# Altium project Wirless Battery Charger.PrjPcb
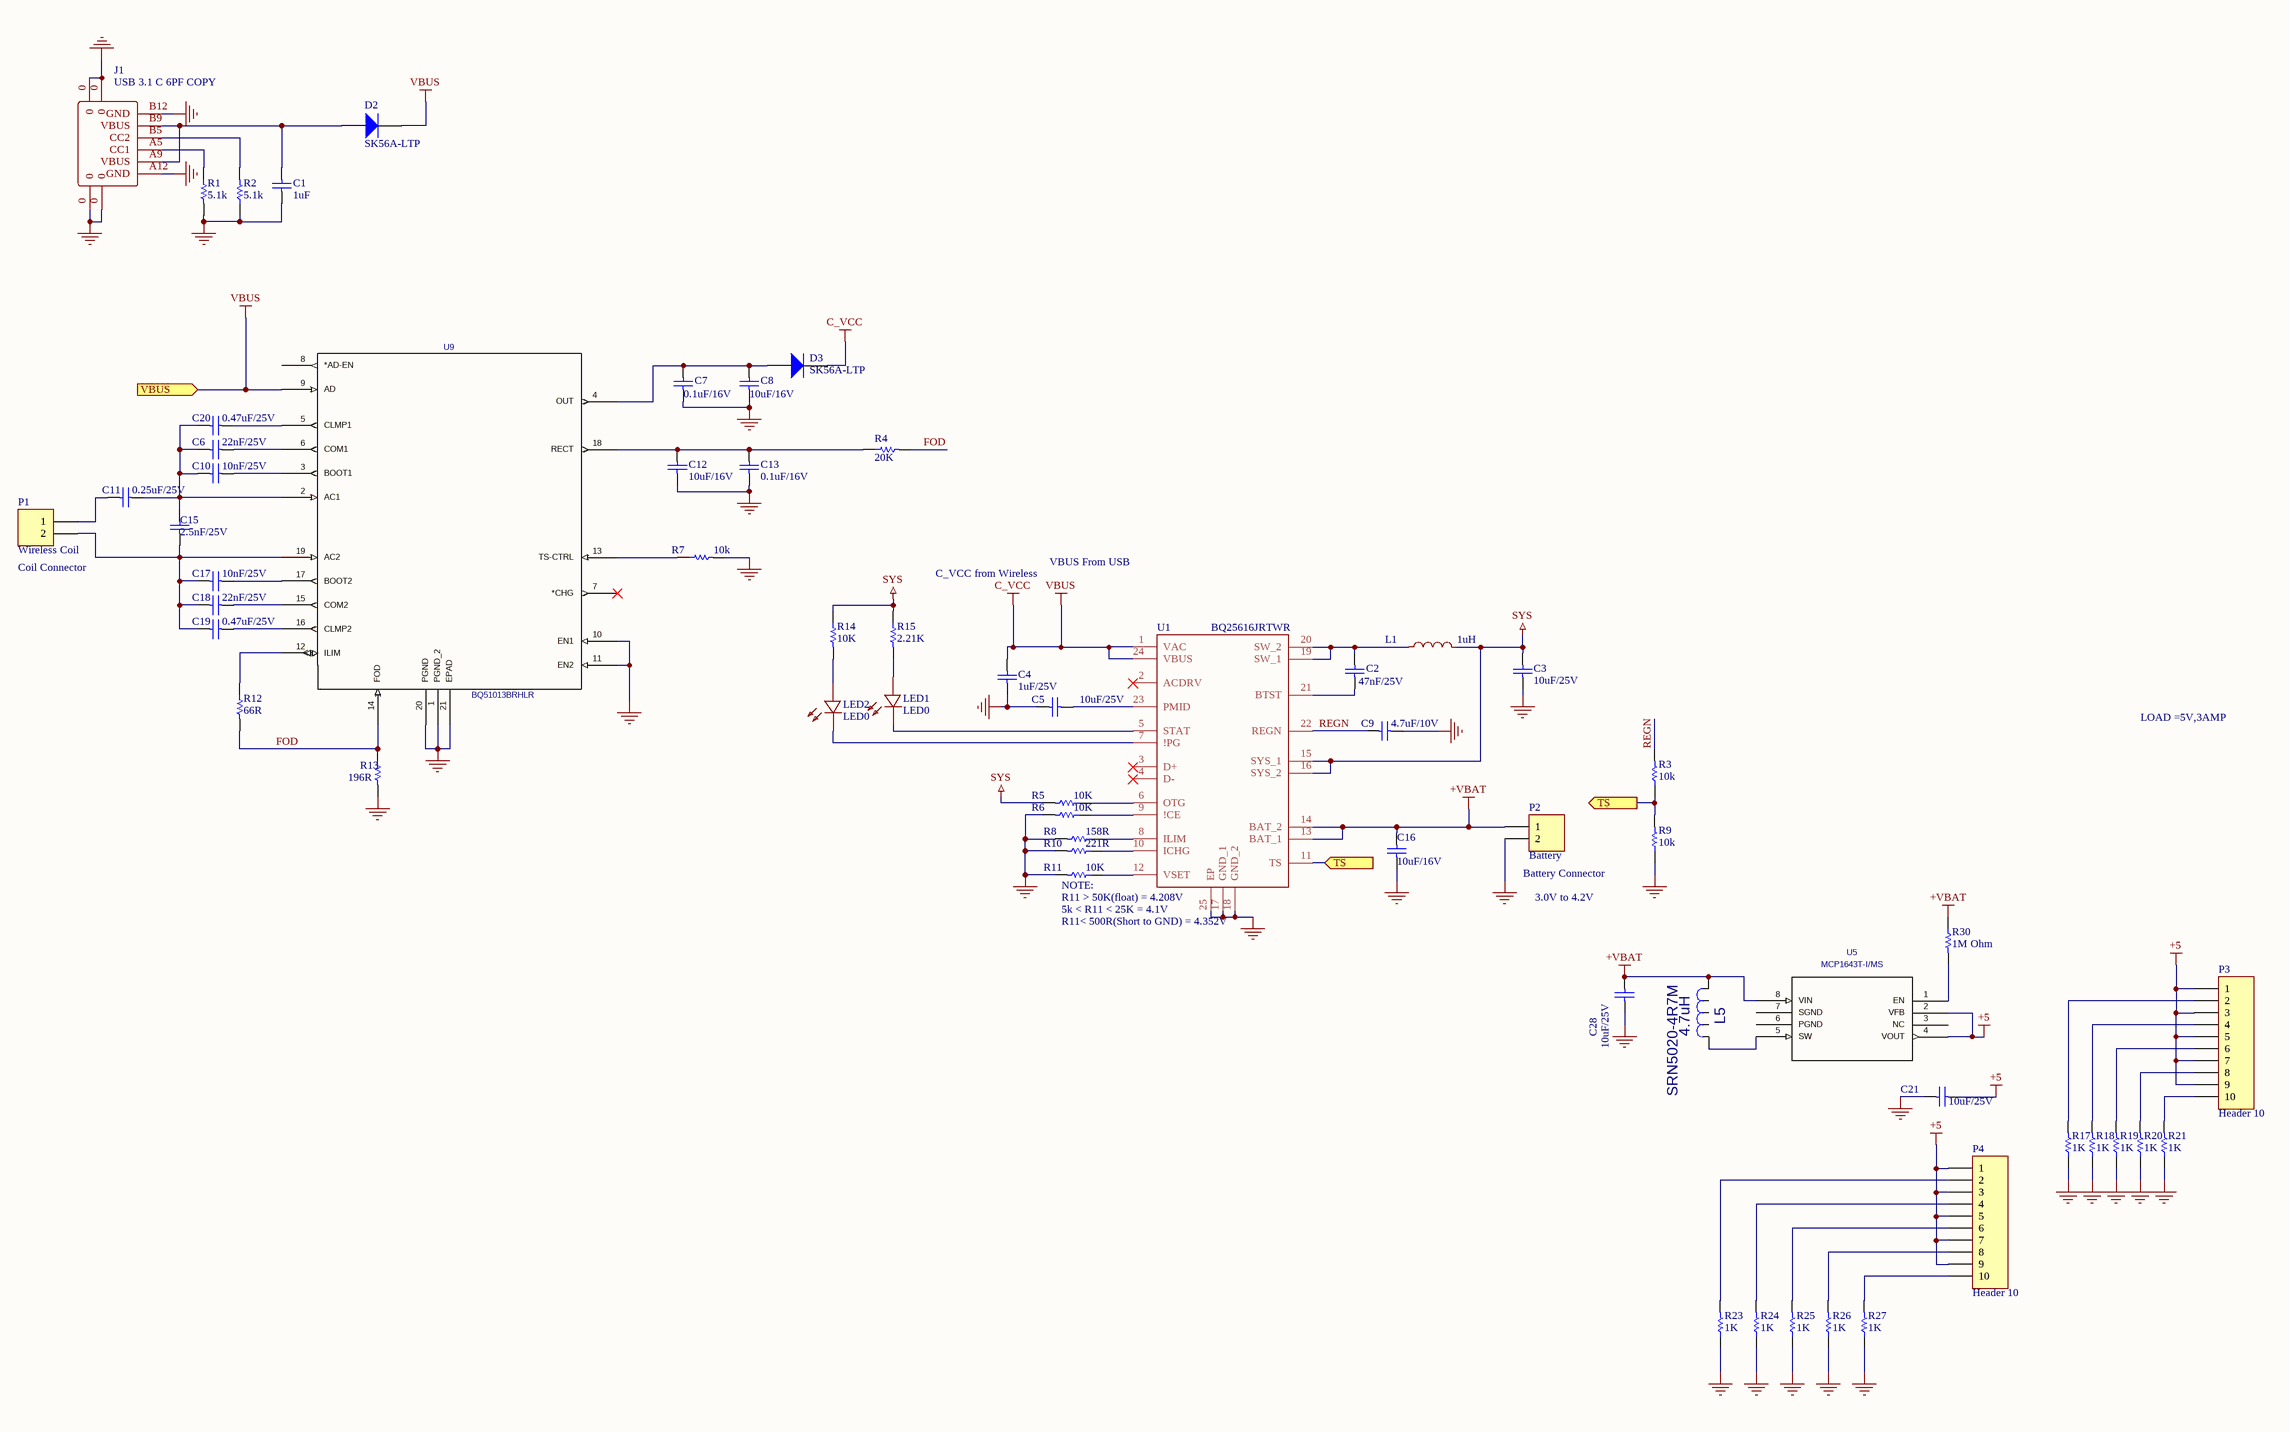
[diagram p0: BQ51013BYFPR_Circuit.SchDoc]
1 sheet, 61 parts. Net scope: flat (ports and power ports of the same name join across sheets).
Board file: PCB_BQ51013BYFPR.PcbDoc

## Sheet BQ51013BYFPR_Circuit.SchDoc
size C

### Parts
C1  value 1uF  [0805-CAP]  (hidden comment: Cap)
C2  value 47nF/25V  [0805-CAP]  (hidden comment: Cap)
C3  value 10uF/25V  [0805-CAP]  (hidden comment: Cap)
C4  value 1uF/25V  [0805-CAP]  (hidden comment: Cap)
C5  value 10uF/25V  [0805-CAP]  (hidden comment: Cap)
C6  value 22nF/25V  [0402-A]  (hidden comment: Cap)
C7  value 0.1uF/16V  [0402-A]  (hidden comment: Cap)
C8  value 10uF/16V  [0805-CAP]  (hidden comment: Cap)
C9  value 4.7uF/10V  [0805-CAP]  (hidden comment: Cap)
C10  value 10nF/25V  [0402-A]  (hidden comment: Cap)
C11  value 0.25uF/25V  [0402-A]  (hidden comment: Cap)
C12  value 10uF/16V  [0805-CAP]  (hidden comment: Cap)
C13  value 0.1uF/16V  [0402-A]  (hidden comment: Cap)
C15  value 2.5nF/25V  [0402-A]  (hidden comment: Cap)
C16  value 10uF/16V  [0805-CAP]  (hidden comment: Cap)
C17  value 10nF/25V  [0402-A]  (hidden comment: Cap)
C18  value 22nF/25V  [0402-A]  (hidden comment: Cap)
C19  value 0.47uF/25V  [0402-A]  (hidden comment: Cap)
C20  value 0.47uF/25V  [0402-A]  (hidden comment: Cap)
C21  value 10uF/25V  [0805-CAP]  (hidden comment: Cap)
C28  value 10uF/25V  [0805-CAP]  (hidden comment: Cap)
D2  SK56A-LTP  [SMC]
D3  SK56A-LTP  [SMC]
J1  USB 3.1 C 6PF COPY  [USB-C-SMD_TYPE-C-USB-13]
L1  1uH  [IND-SMD_L4.1-W3.2]
L5  4.7uH  value SRN5020-4R7M  [IND_BOURNS_SRN50]
LED1  LED0  [1608[0603]_LED]
LED2  LED0  [1608[0603]_LED]
P1  Wireless Coil  [HDR1X2]
P2  Battery  [HDR1X2]
P3  Header 10  [HDR1X10]
P4  Header 10  [HDR1X10]
R1  value 5.1k  [1608[0603]]  (hidden comment: Res1)
R2  value 5.1k  [1608[0603]]  (hidden comment: Res1)
R3  value 10k  [0402-A]  (hidden comment: Res1)
R4  value 20K  [0402-A]  (hidden comment: Res1)
R5  value 10K  [0402-A]  (hidden comment: Res1)
R6  value 10K  [0402-A]  (hidden comment: Res1)
R7  value 10k  [0402-A]  (hidden comment: Res1)
R8  value 158R  [0402-A]  (hidden comment: Res1)
R9  value 10k  [0402-A]  (hidden comment: Res1)
R10  value 221R  [0402-A]  (hidden comment: Res1)
R11  value 10K  [0402-A]  (hidden comment: Res1)
R12  value 66R  [0402-A]  (hidden comment: Res1)
R13  value 196R  [0402-A]  (hidden comment: Res1)
R14  value 10K  [0402-A]  (hidden comment: Res1)
R15  value 2.21K  [0402-A]  (hidden comment: Res1)
R17  value 1K  [0402-A]  (hidden comment: Res1)
R18  value 1K  [0402-A]  (hidden comment: Res1)
R19  value 1K  [0402-A]  (hidden comment: Res1)
R20  value 1K  [0402-A]  (hidden comment: Res1)
R21  value 1K  [0402-A]  (hidden comment: Res1)
R23  value 1K  [0402-A]  (hidden comment: Res1)
R24  value 1K  [0402-A]  (hidden comment: Res1)
R25  value 1K  [0402-A]  (hidden comment: Res1)
R26  value 1K  [0402-A]  (hidden comment: Res1)
R27  value 1K  [0402-A]  (hidden comment: Res1)
R30  value 1M Ohm  [0402-A]  (hidden comment: Res1)
U1  BQ25616JRTWR  [QFN50P400X400X80]
U5  MCP1643T-I/MS  [MSOP8_MC_MCH]
U9  BQ51013BRHLR  [RHL20_2P05X3P05]

### Ports
TS (in), TS (out), VBUS (in)

### Nets
+5: C21.1 P3.1 P3.3 P3.5 P3.7 P3.9 P4.1 P4.3 P4.5 P4.7 P4.9 U5.2(VFB) U5.4(VOUT)
+VBAT: C16.1 C28.2 L5.1 P2.1 R30.1 U1.13(BAT_1) U1.14(BAT_2) U5.8(VIN)
C_VCC: C4.2 D2.2(K) D3.2(K) U1.1(VAC) U1.24(VBUS) U9.9(AD) ; port VBUS  [also labelled VBUS]
GND: C1.2 C3.1 C4.1 C5.2 C7.1 C8.1 C9.1 C12.1 C13.1 C16.2 C21.2 C28.1 J1.0 J1.A12(GND) J1.B12(GND) P2.2 R1.2 R2.1 R6.2 R7.2 R8.2 R9.1 R10.2 R11.2 R13.2 R17.1 R18.1 R19.1 R20.1 R21.1 R23.1 R24.1 R25.1 R26.1 R27.1 U1.17(GND_1) U1.18(GND_2) U1.25(EP) U9.1(PGND_2) U9.10(EN1) U9.11(EN2) U9.20(PGND) U9.21(EPAD)
SYS: C3.2 L1.2 R5.2 R14.1 R15.1 U1.15(SYS_1) U1.16(SYS_2)
FOD: R4.2 R12.2 R13.1 U9.14(FOD)
REGN: C9.2 R3.2 U1.22(REGN)
NetC1_1: C1.1 D2.1(A) J1.A9(VBUS) J1.B9(VBUS)
NetC2_1: C2.1 U1.21(BTST)
NetC2_2: C2.2 L1.1 U1.19(SW_1) U1.20(SW_2)
NetC5_1: C5.1 U1.23(PMID)
NetC6_1: C6.1 C10.1 C11.2 C15.2 C20.1 U9.2(AC1)
NetC6_2: C6.2 U9.6(COM1)
NetC7_2: C7.2 C8.2 D3.1(A) U9.4(OUT)
NetC10_2: C10.2 U9.3(BOOT1)
NetC11_1: C11.1 P1.1
NetC12_2: C12.2 C13.2 R4.1 U9.18(RECT)
NetC15_1: C15.1 C17.1 C18.1 C19.1 P1.2 U9.19(AC2)
NetC17_2: C17.2 U9.17(BOOT2)
NetC18_2: C18.2 U9.15(COM2)
NetC19_2: C19.2 U9.16(CLMP2)
NetC20_2: C20.2 U9.5(CLMP1)
NetJ1_A5: J1.A5(CC1) R1.1
NetJ1_B5: J1.B5(CC2) R2.2
NetL5_2: L5.2 U5.5(SW)
NetLED1_1: LED1.1(A) R15.2
NetLED1_2: LED1.2(K) U1.5(STAT)
NetLED2_1: LED2.1(A) R14.2
NetLED2_2: LED2.2(K) U1.7(!PG)
NetP3_2: P3.2 R17.2
NetP3_4: P3.4 R18.2
NetP3_6: P3.6 R19.2
NetP3_8: P3.8 R20.2
NetP3_10: P3.10 R21.2
NetP4_2: P4.2 R23.2
NetP4_4: P4.4 R24.2
NetP4_6: P4.6 R25.2
NetP4_8: P4.8 R26.2
NetP4_10: P4.10 R27.2
NetR3_1: R3.1 R9.2 U1.11(TS) ; port TS
NetR5_1: R5.1 U1.6(OTG)
NetR6_1: R6.1 U1.9(!CE)
NetR7_1: R7.1 U9.13(TS-CTRL)
NetR8_1: R8.1 U1.8(ILIM)
NetR10_1: R10.1 U1.10(ICHG)
NetR11_1: R11.1 U1.12(VSET)
NetR12_1: R12.1 U9.12(ILIM)
NetR30_2: R30.2 U5.1(EN)

Not connected (* = marked no-connect by the designer): U1 2(ACDRV)* 3(D+)* 4(D-)*; U5 3(NC) 6(PGND) 7(SGND); U9 7(*CHG)* 8(*AD-EN)

### Notes on the sheet
- (near P1) Coil Connector
- C_VCC from Wireless
- VBUS From USB
- LOAD =5V,3AMP
- (near R11) NOTE:
- Battery Connector
- (near U1) R11 > 50K(float) = 4.208V
- 5k < R11 < 25K = 4.1V
- R11< 500R(Short to GND) = 4.352V
- 3.0V to 4.2V

### Library data of the parts
C1-C13 C15-C21 C28 = Cap: Capacitor; Published: 8-Jun-2000; LatestRevisionDate: 17-Jul-2002; LatestRevisionNote: Re-released for DXP Platform.; PackageReference: RAD-0.3; Publisher: Altium Limited; PackageDescription: Radial Cap, Thru-Hole; 2 Leads; 0.3 in Pin Spacing
D2 D3 = Diode: DIODE SCHOTTKY 5A 60V SMA; Published: 8-Jun-2000; LatestRevisionDate: 17-Jul-2002; LatestRevisionNote: Re-released for DXP Platform.; PackageVersion: Sep-1996; PackageReference: SMC; Publisher: Altium Limited; PackageDescription: DO-214-AB/SMC; 2 C-Bend Leads; Body 7.9 x 5.9 mm, inc. leads (LxW); Code_JEDEC: DO-214-AB
L1 = Inductor: value: 1uH
L5 = SRN5020-4R7M: Mfr_Name: Bourns Electronics; C: Copyright (C) 2015 Accelerated Designs. All rights reserved; Copyright: Copyright (C) 2022 Ultra Librarian. All rights reserved.; Manufacturer_Part_Number: SRN5020-4R7M
P1 P2 = Header 2: Header, 2-Pin; LatestRevisionDate: 17-Jul-2002; LatestRevisionNote: Re-released for DXP Platform.; Publisher: Altium Limited
P3 P4 = Header 10: Header, 10-Pin; LatestRevisionDate: 17-Jul-2002; LatestRevisionNote: Re-released for DXP Platform.; Publisher: Altium Limited
R1-R15 R17-R21 R23-R27 R30 = Res1: Resistor; Published: 8-Jun-2000; LatestRevisionDate: 17-Jul-2002; LatestRevisionNote: Re-released for DXP Platform.; PackageReference: AXIAL-0.3; Publisher: Altium Limited; PackageDescription: Axial Device, Thru-Hole; 2 Leads; 0.3 in Pin Spacing
U5 = MCP1643T-I/MS: Mfr_Name: Microchip; C: Copyright (C) 2018 Accelerated Designs. All rights reserved; Value: MCP1643T-I/MS; Copyright: Copyright (C) 2022 Ultra Librarian. All rights reserved.; Manufacturer_Part_Number: MCP1643T-I/MS
U9 = BQ51013BRHLR: Mfr_Name: Texas Instruments; Value: BQ51013BRHLR; Copyright: Copyright (C) 2022 Ultra Librarian. All rights reserved.; Manufacturer_Part_Number: BQ51013BRHLR; Digi-Key_Part_Number_1: 296-38885-1-ND; Digi-Key_Part_Number_2: 296-38885-2-ND; Digi-Key_Part_Number_3: 296-38885-6-ND; Digi-Key_Part_Number_4: BQ51013BRHLR-ND